# Altium schematic sheet CAM_IF.SchDoc
size A4; SheetNumber: 5; SheetTotal: 9
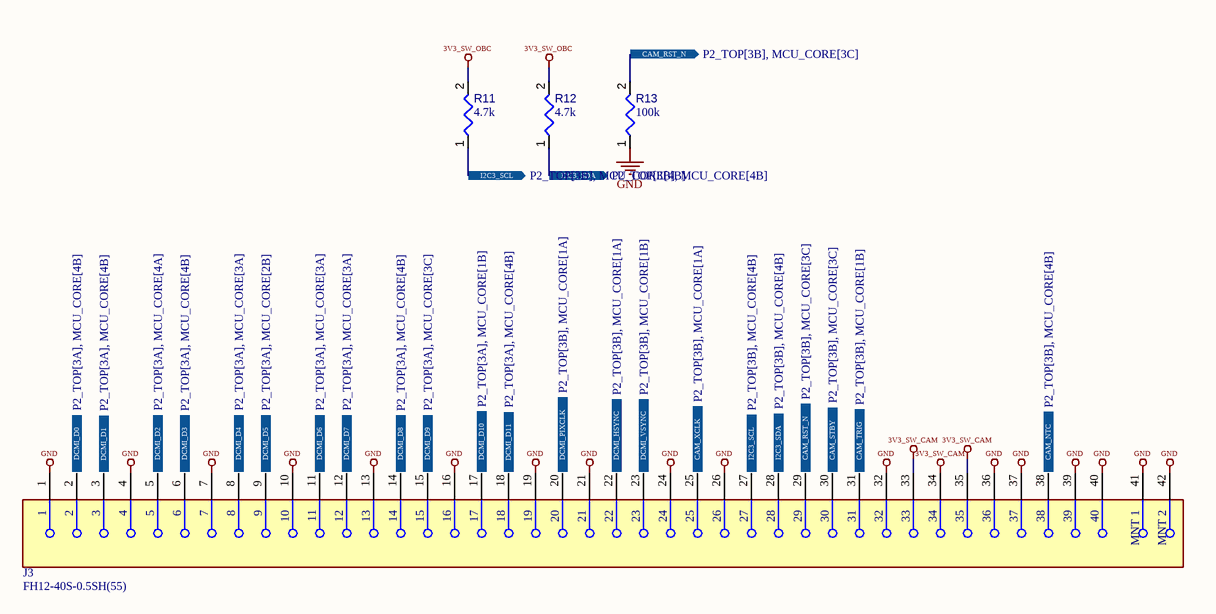
[diagram p0: CAM_IF.SchDoc]

## Parts
J3  FH12-40S-0.5SH(55)  [FP-FH12-40S-0_5SH_55-MFG]
R11  value 4.7k  [RESC0402(1005)_L]  (hidden comment: Resistor 4K7  +/-1 % 0402 63 mW)
R12  value 4.7k  [RESC0402(1005)_L]  (hidden comment: Resistor 4K7  +/-1 % 0402 63 mW)
R13  value 100k  [RESC1005X40X25ML05T05]  (hidden comment: Resistor 100k +/-1% 0402 100 mW)

## Ports
CAM_NTC (out, see P2_TOP[3B], MCU_CORE[4B]), CAM_RST_N (out, see P2_TOP[3B], MCU_CORE[3C]), CAM_STBY (out, see P2_TOP[3B], MCU_CORE[3C]), CAM_TRIG (out, see P2_TOP[3B], MCU_CORE[1B]), CAM_XCLK (out, see P2_TOP[3B], MCU_CORE[1A]), DCMI_D0 (out, see P2_TOP[3A], MCU_CORE[4B]), DCMI_D1 (out, see P2_TOP[3A], MCU_CORE[4B]), DCMI_D2 (out, see P2_TOP[3A], MCU_CORE[4A]), DCMI_D3 (out, see P2_TOP[3A], MCU_CORE[4B]), DCMI_D4 (out, see P2_TOP[3A], MCU_CORE[3A]), DCMI_D5 (out, see P2_TOP[3A], MCU_CORE[2B]), DCMI_D6 (out, see P2_TOP[3A], MCU_CORE[3A]), DCMI_D7 (out, see P2_TOP[3A], MCU_CORE[3A]), DCMI_D8 (out, see P2_TOP[3A], MCU_CORE[4B]), DCMI_D9 (out, see P2_TOP[3A], MCU_CORE[3C]), DCMI_D10 (out, see P2_TOP[3A], MCU_CORE[1B]), DCMI_D11 (out, see P2_TOP[3A], MCU_CORE[4B]), DCMI_HSYNC (out, see P2_TOP[3B], MCU_CORE[1A]), DCMI_PIXCLK (out, see P2_TOP[3B], MCU_CORE[1A]), DCMI_VSYNC (out, see P2_TOP[3B], MCU_CORE[1B]), I2C3_SCL (out, see P2_TOP[3B], MCU_CORE[4B]), I2C3_SDA (out, see P2_TOP[3B], MCU_CORE[4B])

## Nets
3V3_SW_CAM: J3.33 J3.34 J3.35
3V3_SW_OBC: R11.2 R12.2
GND: J3.1 J3.4 J3.7 J3.10 J3.13 J3.16 J3.19 J3.21 J3.24 J3.26 J3.32 J3.36 J3.37 J3.39 J3.40 J3.41(MNT_1) J3.42(MNT_2) R13.1
CAM_NTC: J3.38 ; port CAM_NTC
CAM_RST_N: J3.29 R13.2 ; port CAM_RST_N
CAM_STBY: J3.30 ; port CAM_STBY
CAM_TRIG: J3.31 ; port CAM_TRIG
CAM_XCLK: J3.25 ; port CAM_XCLK
DCMI_D0: J3.2 ; port DCMI_D0
DCMI_D1: J3.3 ; port DCMI_D1
DCMI_D2: J3.5 ; port DCMI_D2
DCMI_D3: J3.6 ; port DCMI_D3
DCMI_D4: J3.8 ; port DCMI_D4
DCMI_D5: J3.9 ; port DCMI_D5
DCMI_D6: J3.11 ; port DCMI_D6
DCMI_D7: J3.12 ; port DCMI_D7
DCMI_D8: J3.14 ; port DCMI_D8
DCMI_D9: J3.15 ; port DCMI_D9
DCMI_D10: J3.17 ; port DCMI_D10
DCMI_D11: J3.18 ; port DCMI_D11
DCMI_HSYNC: J3.22 ; port DCMI_HSYNC
DCMI_PIXCLK: J3.20 ; port DCMI_PIXCLK
DCMI_VSYNC: J3.23 ; port DCMI_VSYNC
I2C3_SCL: J3.27 R11.1 ; port I2C3_SCL
I2C3_SDA: J3.28 R12.1 ; port I2C3_SDA

## Library data of the parts
J3 = CMP-002-00080-1: FFC/FPC Connectors; FH12-40S-0.5SH(55); HIROSE ELECTRIC; 500 mA; Yes; Gold; 40; Connector Type: Receptacle; Number of Positions: 40; Current Rating: 500mA; Contact Resistance: 50mΩ; Max Voltage Rating (AC): 50V; Gender: Female; Pitch: 508µm; Contact Pitch: 500µm; Plating Thickness: 50.8nm; Dielectric Material: Polyamide; Insulation Resistance: 500MΩ; Actuator Material: Polyphenylene; Wire/Cable Type: Straight; Max Current Rating: 400mA; Contact Location: Bottom; Number of Rows: 1; Min Operating Temperature: -40°C; Termination: Solder; Terminal Pitch: 500µm; Lifecycle Status: Production; Max Operating Temperature: 85°C; RoHS: Compliant; Contact Material: Gold, Nickel; Flammability Rating: UL94 V-0; Pins: 40; Lead Free: Lead Free; Mounting Technology: Surface Mount; Contact Voltage Rating (AC): 50V; Height: 2mm; Voltage Rating: 50V; Housing Color: Brown; Voltage Rating (AC): 50V; Orientation: Right Angle; Packaging: Cut Tape; Contact Plating: Gold; Color: Beige, Brown; Width: 6.4mm; REACH SVHC: Unaffected; Insulation Material: Nylon; Length: 24.1mm; Depth: 5.6mm; Lead Pitch: 500µm; Number of Contacts: 40
R11 R12 = CMP-009-00158-3: Chip Resistor, 4,7 kOhms, +/-1 %, 63 mW, -55 to 155 degC, 0402; Power: 63mW; Tolerance: 1%; Max Operating Temperature: 155°C; Pins: 2; Min Operating Temperature: -55°C; Case/Package: 0402
R13 = CMP-009-00022-5: Chip Resistor, 100 KOhm, +/- 1%, 0.1 W, -55 to 155 degC, 0402 (1005 Metric); Power: 100mW; Voltage Rating: 50V; Mounting Technology: SM; Pins: 2; Min Operating Temperature: -55°C; Tolerance: 1%; RoHS Compliant: True; Case/Package: 0402; Max Operating Temperature: 155°C